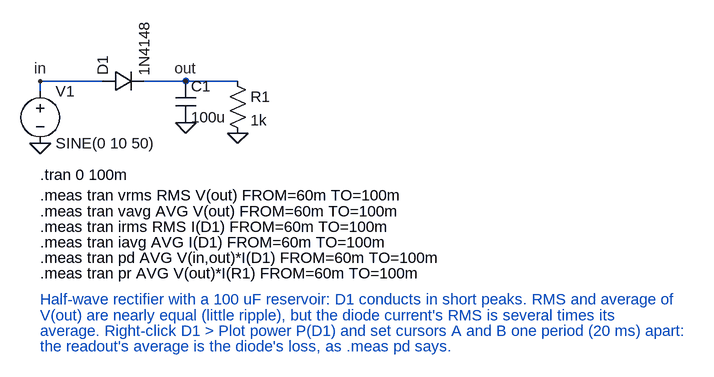
[diagram p0: schematic rectifier_rms.asc]
rectifier_rms.asc, the LTspice schematic file:
Version 4
SHEET 1 880 680
WIRE 0 96 0 80
WIRE 0 80 96 80
WIRE 160 80 224 80
WIRE 224 80 304 80
FLAG 0 80 in
FLAG 224 80 out
FLAG 0 176 0
FLAG 224 144 0
FLAG 304 160 0
SYMBOL voltage 0 80 R0
SYMATTR InstName V1
SYMATTR Value SINE(0 10 50)
SYMBOL diode 96 96 R270
SYMATTR InstName D1
SYMATTR Value 1N4148
SYMBOL cap 208 80 R0
SYMATTR InstName C1
SYMATTR Value 100u
SYMBOL res 288 64 R0
SYMATTR InstName R1
SYMATTR Value 1k
TEXT 0 224 Left 2 !.tran 0 100m
TEXT 0 256 Left 2 !.meas tran vrms RMS V(out) FROM=60m TO=100m
TEXT 0 280 Left 2 !.meas tran vavg AVG V(out) FROM=60m TO=100m
TEXT 0 304 Left 2 !.meas tran irms RMS I(D1) FROM=60m TO=100m
TEXT 0 328 Left 2 !.meas tran iavg AVG I(D1) FROM=60m TO=100m
TEXT 0 352 Left 2 !.meas tran pd AVG V(in,out)*I(D1) FROM=60m TO=100m
TEXT 0 376 Left 2 !.meas tran pr AVG V(out)*I(R1) FROM=60m TO=100m
TEXT 0 416 Left 2 ;Half-wave rectifier with a 100 uF reservoir: D1 conducts in short peaks. RMS and average of
TEXT 0 440 Left 2 ;V(out) are nearly equal (little ripple), but the diode current's RMS is several times its
TEXT 0 464 Left 2 ;average. Right-click D1 > Plot power P(D1) and set cursors A and B one period (20 ms) apart:
TEXT 0 488 Left 2 ;the readout's average is the diode's loss, as .meas pd says.

The netlist it stands for:
* rectifier_rms.asc
V1 in 0 SINE(0 10 50)
D1 in out 1N4148
C1 out 0 100u
R1 out 0 1k
.model D D
.lib standard.dio
.tran 0 100m
.meas tran vrms RMS V(out) FROM=60m TO=100m
.meas tran vavg AVG V(out) FROM=60m TO=100m
.meas tran irms RMS I(D1) FROM=60m TO=100m
.meas tran iavg AVG I(D1) FROM=60m TO=100m
.meas tran pd AVG V(in,out)*I(D1) FROM=60m TO=100m
.meas tran pr AVG V(out)*I(R1) FROM=60m TO=100m
* Half-wave rectifier with a 100 uF reservoir: D1 conducts in short peaks. RMS and average of
* V(out) are nearly equal (little ripple), but the diode current's RMS is several times its
* average. Right-click D1 > Plot power P(D1) and set cursors A and B one period (20 ms) apart:
* the readout's average is the diode's loss, as .meas pd says.
.backanno
.end